# Altium project ArmBand-Sensor-Board_v2.0.PrjPcb
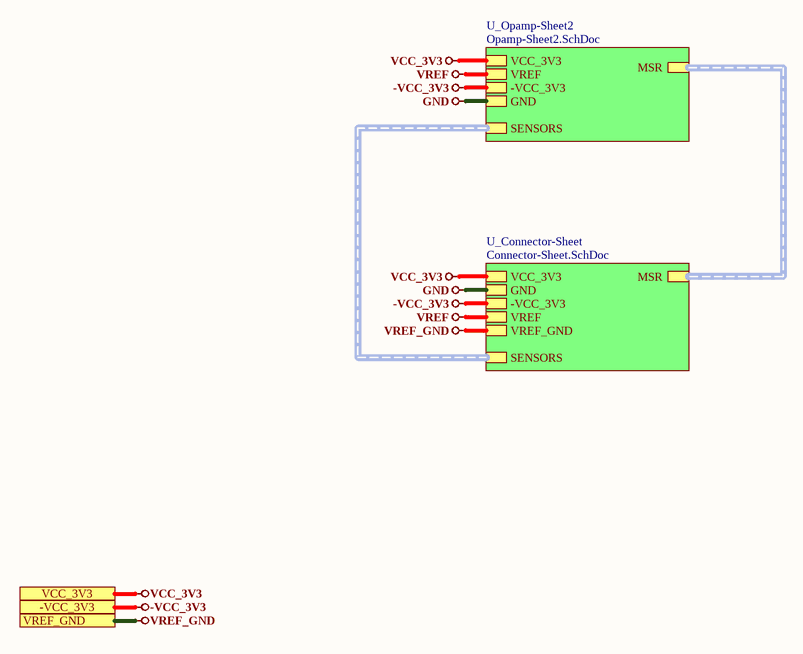
[diagram p0: Top-Sheet.SchDoc]
3 sheets, 46 parts. Net scope: hierarchical (ports join the sheet entries above them; power ports are global).
Board file: ArmBand-Sensor-Board_v2.0.PcbDoc
Sheets:
  Top-Sheet.SchDoc
    U_Opamp-Sheet2 = Opamp-Sheet2.SchDoc
    U_Connector-Sheet = Connector-Sheet.SchDoc

## Sheet Top-Sheet.SchDoc
size A4; DocumentNumber: 1; SheetNumber: 1; SheetTotal: 3

### Sub-sheets
U_Connector-Sheet = Connector-Sheet.SchDoc: SENSORS (harness SENSORS), MSR (harness MSR), -VCC_3V3, VCC_3V3, GND, VREF, VREF_GND
U_Opamp-Sheet2 = Opamp-Sheet2.SchDoc: SENSORS (harness SENSORS), -VCC_3V3, VREF, VCC_3V3, MSR (harness MSR), GND

### Ports
-VCC_3V3, VCC_3V3, VREF_GND

### Nets
-VCC_3V3: port -VCC_3V3, sheet U_Opamp-Sheet2/-VCC_3V3, sheet U_Connector-Sheet/-VCC_3V3
GND: sheet U_Opamp-Sheet2/GND, sheet U_Connector-Sheet/GND
VCC_3V3: port VCC_3V3, sheet U_Opamp-Sheet2/VCC_3V3, sheet U_Connector-Sheet/VCC_3V3
VREF: sheet U_Opamp-Sheet2/VREF, sheet U_Connector-Sheet/VREF
VREF_GND: port VREF_GND, sheet U_Connector-Sheet/VREF_GND

### Buses and harness runs
harness sheet U_Connector-Sheet/MSR = sheet U_Opamp-Sheet2/MSR
harness sheet U_Connector-Sheet/SENSORS = sheet U_Opamp-Sheet2/SENSORS

### Notes on the sheet
- 1
- Huzaifa Ali

## Sheet Opamp-Sheet2.SchDoc
size A4; DocumentNumber: 2; SheetNumber: 2; SheetTotal: 3
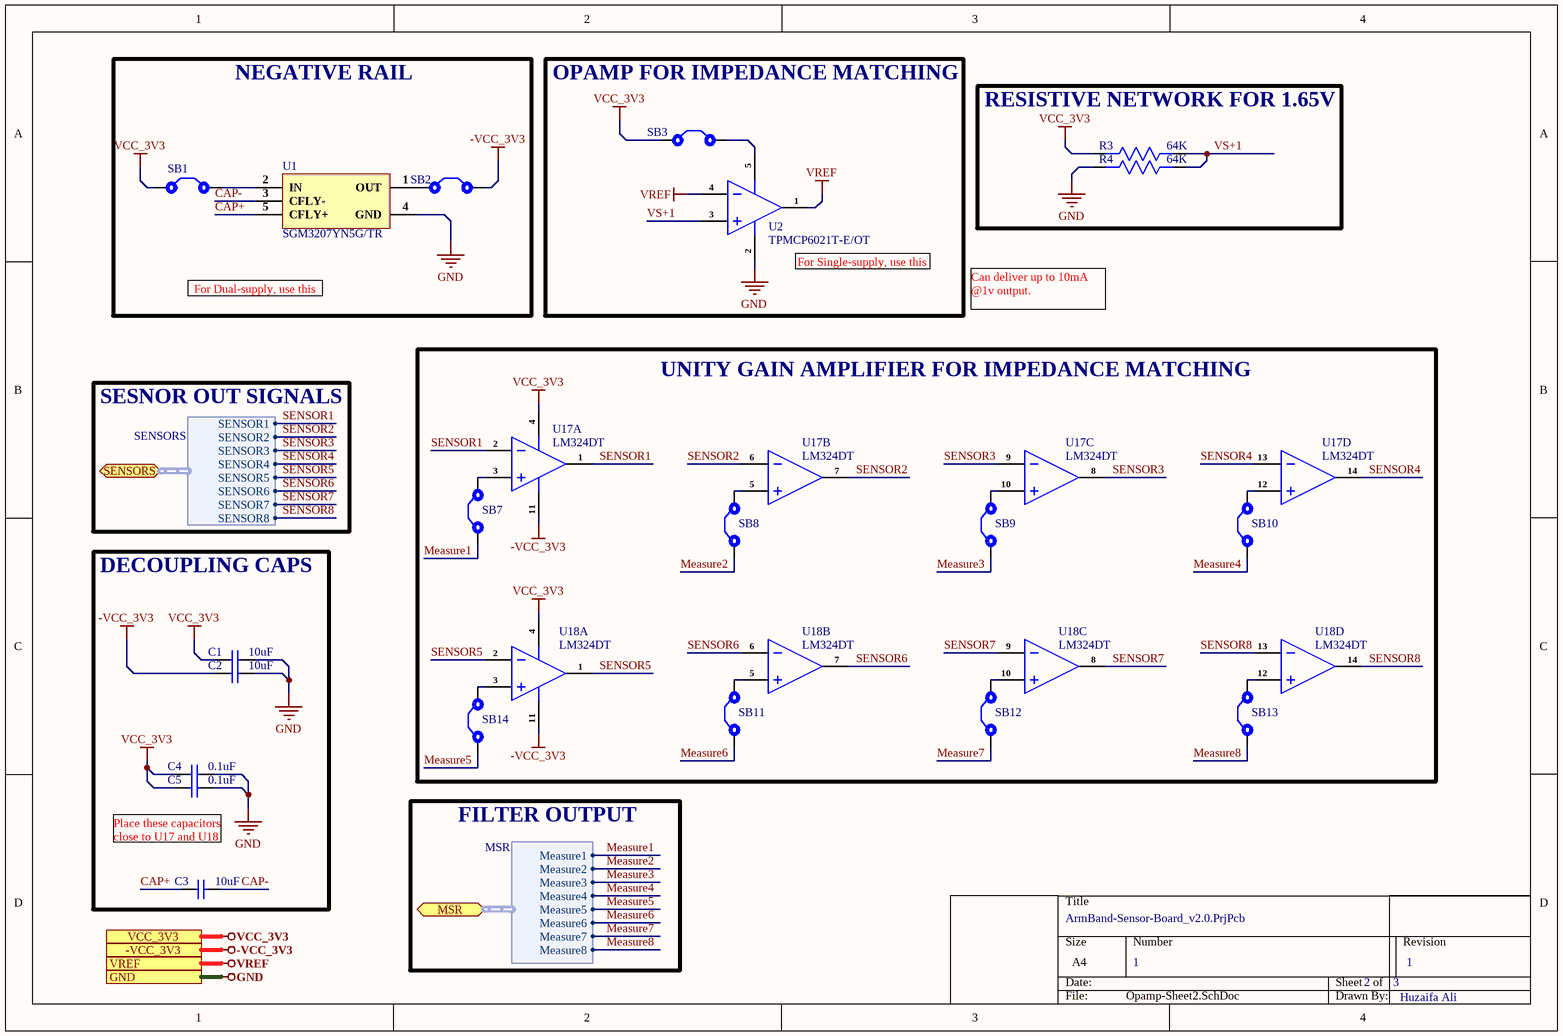
[diagram p1: Opamp-Sheet2.SchDoc]

### Parts
C1  10uF  [Cap-0603]
C2  10uF  [Cap-0603]
C3  10uF  [Cap-0603]
C4  0.1uF  [Cap-0402]
C5  0.1uF  [Cap-0402]
R3  64K  [Res-0603]
R4  64K  [Res-0603]
SB1  Solder Bridge  [Solder Bridge]  (value not drawn)
SB2  Solder Bridge  [Solder Bridge]  (value not drawn)
SB3  Solder Bridge  [Solder Bridge]  (value not drawn)
SB7  Solder Bridge 0603  [Solder Bridge]  (value not drawn)  (no BOM)
SB8  Solder Bridge 0603  [Solder Bridge]  (value not drawn)  (no BOM)
SB9  Solder Bridge 0603  [Solder Bridge]  (value not drawn)  (no BOM)
SB10  Solder Bridge 0603  [Solder Bridge]  (value not drawn)  (no BOM)
SB11  Solder Bridge 0603  [Solder Bridge]  (value not drawn)  (no BOM)
SB12  Solder Bridge 0603  [Solder Bridge]  (value not drawn)  (no BOM)
SB13  Solder Bridge 0603  [Solder Bridge]  (value not drawn)  (no BOM)
SB14  Solder Bridge 0603  [Solder Bridge]  (value not drawn)  (no BOM)
U1  SGM3207YN5G/TR  [SOT-23-5]
U2  TPMCP6021T-E/OT  [SOT-23-5]
U17  LM324DT  [SO-14]  (parts A,B,C,D of 4)
U18  LM324DT  [SO-14]  (parts A,B,C,D of 4)

### Blocks framed on the sheet
NEGATIVE RAIL: SB1 SB2 U1
OPAMP FOR IMPEDANCE MATCHING: SB3 U2
RESISTIVE NETWORK FOR 1.65V: R3 R4
UNITY GAIN AMPLIFIER FOR IMPEDANCE MATCHING: SB7-SB14 U17 U18
DECOUPLING CAPS: C1-C5

### Ports
-VCC_3V3, GND, MSR (bidir, harness MSR), SENSORS (bidir, harness SENSORS), VCC_3V3, VREF

### Harnesses
SENSORS: SENSOR1, SENSOR2, SENSOR3, SENSOR4, SENSOR5, SENSOR6, SENSOR7, SENSOR8
MSR: Measure1, Measure2, Measure3, Measure4, Measure5, Measure6, Measure7, Measure8

### Nets
-VCC_3V3: C2.1 SB2.2 U17.11(VCC-) U18.11(VCC-) ; port -VCC_3V3
GND: C1.2 C2.2 C4.2 C5.2 R4.2 U1.4(GND) U2.2(V-) ; port GND
VCC_3V3: C1.1 C4.1 C5.1 R3.2 SB1.1 SB3.1 U17.4(VCC+) U18.4(VCC+) ; port VCC_3V3
VREF: U2.1(OUT) U2.4(IN-) ; port VREF
CAP+: C3.1 U1.5(CFLY+)
CAP-: C3.2 U1.3(CFLY-)
Measure1: SB7.1 ; port MSR.Measure1
Measure2: SB8.1 ; port MSR.Measure2
Measure3: SB9.1 ; port MSR.Measure3
Measure4: SB10.1 ; port MSR.Measure4
Measure5: SB14.1 ; port MSR.Measure5
Measure6: SB11.1 ; port MSR.Measure6
Measure7: SB12.1 ; port MSR.Measure7
Measure8: SB13.1 ; port MSR.Measure8
SENSOR1: U17.1(1OUT) U17.2(IN-) ; port SENSORS.SENSOR1
SENSOR2: U17.6(2IN-) U17.7(2OUT) ; port SENSORS.SENSOR2
SENSOR3: U17.8(3OUT) U17.9(3IN-) ; port SENSORS.SENSOR3
SENSOR4: U17.13(4IN-) U17.14(4OUT) ; port SENSORS.SENSOR4
SENSOR5: U18.1(1OUT) U18.2(IN-) ; port SENSORS.SENSOR5
SENSOR6: U18.6(2IN-) U18.7(2OUT) ; port SENSORS.SENSOR6
SENSOR7: U18.8(3OUT) U18.9(3IN-) ; port SENSORS.SENSOR7
SENSOR8: U18.13(4IN-) U18.14(4OUT) ; port SENSORS.SENSOR8
VS+1: R3.1 R4.1 U2.3(IN+)
NetSB1_2: SB1.2 U1.2(IN)
NetSB2_1: SB2.1 U1.1(OUT)
NetSB3_2: SB3.2 U2.5(V+)
NetSB7_2: SB7.2 U17.3(IN+)
NetSB8_2: SB8.2 U17.5(2IN+)
NetSB9_2: SB9.2 U17.10(3IN+)
NetSB10_2: SB10.2 U17.12(4IN+)
NetSB11_2: SB11.2 U18.5(2IN+)
NetSB12_2: SB12.2 U18.10(3IN+)
NetSB13_2: SB13.2 U18.12(4IN+)
NetSB14_2: SB14.2 U18.3(IN+)

### Notes on the sheet
- For Dual-supply, use this
- (near U2) For Single-supply, use this
- Can deliver up to 10mA @1v output.
- SESNOR OUT SIGNALS
- Place these capacitors close to U17 and U18
- FILTER OUTPUT
- 1
- Huzaifa Ali

### Library data of the parts
C1-C3 = CL10A106MA8NRNC: CAP CER 10UF 25V X5R 0603; Manufacturer: Samsung; Tolerance: 20%; Supplier 1: Avnet; Manufacturer Part Number: CL10A106MA8NRNC; RoHS: Yes; Category: Ceramic Capacitors; Pricing 1: 4000=0.03753, 8000=0.03700, 16000=0.03595, 24000=0.03515, 32000=0.03383, 40000=0.03304, 400000=0.03225 (USD); Mount: Surface Mount; Case/Package: 0603; Case Code (Metric): 1608; Case Code (Imperial): 0603; Contact Plating: Tin; Min Operating Temperature: -55°C; Max Operating Temperature: 85°C; Package Quantity: 1; Packaging: Tape and Reel; Capacitance: 10uF; Voltage Rating: 25V; Dielectric: X5R; Termination: Wraparound; Series: CL; Construction: Flat; Length: 0.063inch; Width: 0.031inch; Thickness: 0.035inch; Lead Free: Lead Free; RoHS Compliant: Yes; ComponentLink1URL: https://datasheet.ciiva.com/25766/cl10a106ma8nrnc-25766562.pdf?src-supplier=Digi-Key; ComponentLink1Description: https://datasheet.ciiva.com/25766/cl10a106ma8nrnc-25766562.pdf?src-supplier=Digi-Key; Supplier Part Number 1: CL10A106MA8NRNC; LCSC Part Number: C96446
C4 C5 = GRM155R71H104ME14D: CAP CER 0.1UF 50V X7R 0402; Manufacturer: Murata; Tolerance: 20%; Capacitance: 100nF; Item Type: Capacitor; Supplier 1: Avnet; Manufacturer Part Number: GRM155R71H104ME14D; Stock 1: 100000; Pricing 1: 10000=0.00444, 20000=0.00420, 40000=0.00396, 60000=0.00372, 80000=0.00348, 100000=0.00324, 1000000=0.00300 (USD); Mount: Surface Mount; Case/Package: 0402; Min Operating Temperature: -55°C; Max Operating Temperature: 125°C; Packaging: Cut Tape; Voltage Rating: 50V; Length: 0.039inch; Width: 0.02inch; Thickness: 0.022inch; ComponentLink1URL: http://www.mouser.com/ds/2/281/c02e-2905.pdf?src-supplier=Mouser; ComponentLink1Description: http://www.mouser.com/ds/2/281/c02e-2905.pdf?src-supplier=Mouser; ComponentLink2URL: http://search.murata.co.jp/Ceramy/image/img/A01X/G101/ENG/GRM155R71H104ME14-01.pdf?src-supplier=Digi-Key; ComponentLink2Description: http://search.murata.co.jp/Ceramy/image/img/A01X/G101/ENG/GRM155R71H104ME14-01.pdf?src-supplier=Digi-Key; ComponentLink3URL: http://psearch.en.murata.com/capacitor/product/GRM155R71H104ME14%23.pdf?src-supplier=Avnet; ComponentLink3Description: http://psearch.en.murata.com/capacitor/product/GRM155R71H104ME14%23.pdf?src-supplier=Avnet; Supplier Part Number 1: GRM155R71H104ME14D; RoHS: Yes; Category: Ceramic Capacitors; RoHS Compliant: Yes; LCSC Part Number: C182412
R3 R4 = ARG03DTC6402N: 1/10W Thin Film Resistor 75V ±0.5% ±25ppm/℃ -55℃~+155℃ 64kΩ 0603 Chip Resistor - Surface Mount ROHS; Manufacturer: iking Tech; Value: 64K; Manufacturer Part Number: ARG03DTC6402N; Footprint: 0603; ComponentLink1Description: LCSC; ComponentLink1URL: https://lcsc.com/product-detail/Chip-Resistor-Surface-Mount_Viking-Tech-ARG03DTC6402N_C2902643.html; LCSC Part Number: C2902643; Item Type: Resistor
SB1-SB3 = Solder Bridge: Solder Bridge ON
SB7-SB14 = Solder Bridge 0603: Solder Bridge ON; Manufacturer Part Number: Solder Bridge; Item Type: Solder Bridge
U1 = SGM3207YN5G/TR: NO Charge pump 1 -5.5V~-1.4V 1.4V~5.5V 60mA 19kHz SOT-23-5 DC-DC Converters ROHS; Manufacturer: SG Micro; Item Type: IC; Supplier 1: Avnet; Manufacturer Part Number: SGM3207YN5G/TR; RoHS: No; Category: Uncategorized; Pricing 1: 3000=0.38750, 6000=0.36250, 12000=0.33750, 18000=0.32500, 24000=0.31250, 30000=0.31250, 300000=0.30500 (USD); LCSC Part Number: C80403; Supplier Part Number 1: SGM3207YN5G/TR
U2 = TPMCP6021T-E/OT: SOT-23-5 Operational Amplifier ROHS; Manufacturer: TECH PUBLIC; Item Type: IC; Manufacturer Part Number: TPMCP6021T-E/OT; LCSC Part Number: C2923365; ComponentLink1Description: LCSC; ComponentLink1URL: https://www.lcsc.com/product-detail/Operational-Amplifier_TECH-PUBLIC-TPMCP6021T-E-OT_C2923365.html
U17 U18 = LM324DT: IC OPAMP GP 1.3MHZ 14SO; Manufacturer: STMicroelectronics; Max Supply Voltage: 30V; Min Supply Voltage: 3V; Min Dual Supply Voltage: 1.5V; Max Dual Supply Voltage: 15V; Voltage Gain: 100dB; Slew Rate: 0.4V/µs; Common Mode Rejection Ratio: 70dB; Nominal Supply Current: 1.2mA; Input Offset Voltage (Vos): 7mV; Input Bias Current: 150nA; Number of Circuits: 4; Output Current per Channel: 40mA; Dual Supply Voltage: 12V; Supply Type: Single,Dual; Input Voltage Noise Density: 40nV/sqrt Hz; Max Power Dissipation: 400mW; Supplier 1: Arrow Electronics; Manufacturer Part Number: LM324DT; RoHS: Yes; Category: Amplifiers - Op Amps, Buffer, Instrumentation; Stock 1: 287500; Pricing 1: 2500=0.18900 (USD); Mount: Surface Mount; Case/Package: SO; Number of Pins: 14; Contact Plating: Tin,Matte; Weight: 0.009143oz; Min Operating Temperature: 0°C; Max Operating Temperature: 70°C; Gain Bandwidth Product: 1.3MHz; Packaging: Cut Tape; Package Quantity: 2500; Operating Supply Current: 1.2mA; Operating Supply Voltage: 15V; Number of Channels: 4; Output Current: 40mA; Number of Elements: 4; Series: LM324; Technology: BIPOLAR; Bandwidth: 1.3MHz; Number of Amplifiers: 4; Unity Gain Bandwidth Product: 1.3MHz; Length: 8.75mm; Width: 4mm; Height: 1.65mm; Radiation Hardening: No; RoHS Compliant: Yes; Lead Free: Lead Free; REACH SVHC: No SVHC; ComponentLink1URL: https://datasheet.ciiva.com/4758/cd00000457-103203-4758032.pdf?src-supplier=Mouser; ComponentLink1Description: https://datasheet.ciiva.com/4758/cd00000457-103203-4758032.pdf?src-supplier=Mouser; ComponentLink2URL: https://datasheet.ciiva.com/8008/1834360-8008827.pdf?src-supplier=Element14; ComponentLink2Description: https://datasheet.ciiva.com/8008/1834360-8008827.pdf?src-supplier=Element14; ComponentLink3URL: https://datasheet.ciiva.com/8008/1834360-8008490.pdf?src-supplier=Element14; ComponentLink3Description: https://datasheet.ciiva.com/8008/1834360-8008490.pdf?src-supplier=Element14; ComponentLink4URL: https://datasheet.ciiva.com/28630/1834360-28630538.pdf?src-supplier=Element14; ComponentLink4Description: https://datasheet.ciiva.com/28630/1834360-28630538.pdf?src-supplier=Element14; ComponentLink5URL: https://datasheet.ciiva.com/1795/cd00000457-1795560.pdf?src-supplier=Digi-Key; ComponentLink5Description: https://datasheet.ciiva.com/1795/cd00000457-1795560.pdf?src-supplier=Digi-Key; ComponentLink6URL: https://datasheet.ciiva.com/1795/cd00000457-1795559.pdf?src-supplier=Digi-Key; ComponentLink6Description: https://datasheet.ciiva.com/1795/cd00000457-1795559.pdf?src-supplier=Digi-Key; ComponentLink7URL: https://datasheet.ciiva.com/1795/cd00000457-1795561.pdf?src-supplier=Digi-Key; ComponentLink7Description: https://datasheet.ciiva.com/1795/cd00000457-1795561.pdf?src-supplier=Digi-Key; ComponentLink8URL: https://datasheet.ciiva.com/16375/cd00000457-16375528.pdf?src-supplier=Future+Electronics; ComponentLink8Description: https://datasheet.ciiva.com/16375/cd00000457-16375528.pdf?src-supplier=Future+Electronics; Supplier Part Number 1: LM324DT

## Sheet Connector-Sheet.SchDoc
size A4; DocumentNumber: 3; SheetNumber: 3; SheetTotal: 3
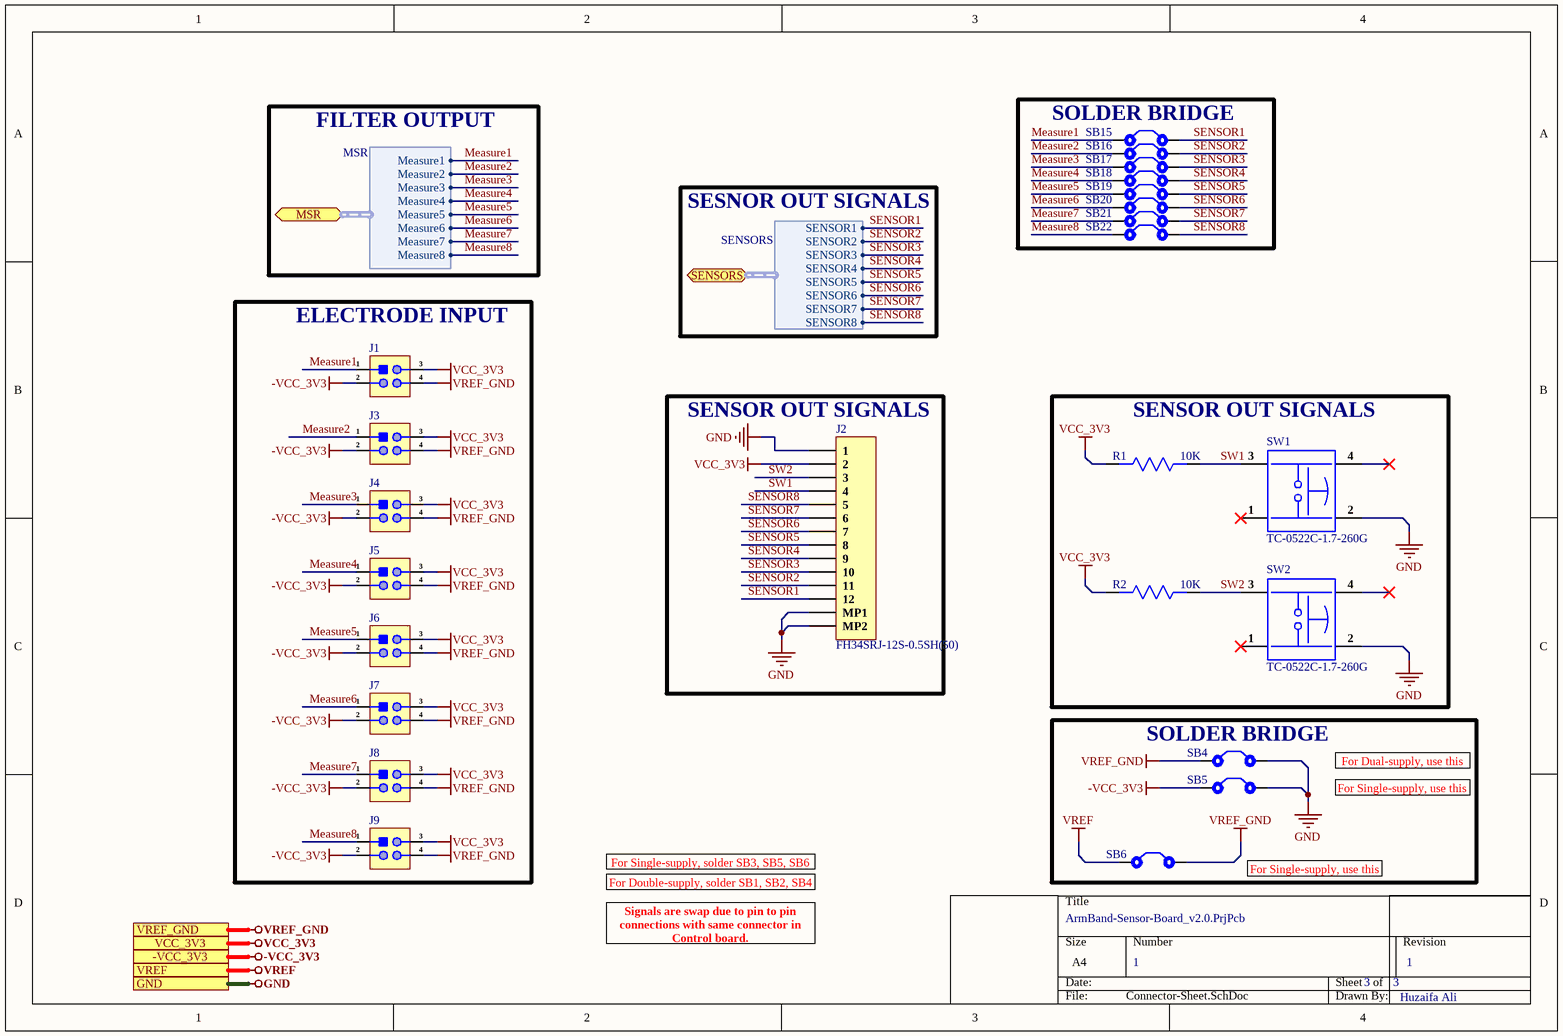
[diagram p2: Connector-Sheet.SchDoc]

### Parts
J1  2x2 Pad  [2x2 Pad]  (value not drawn)  (no BOM)
J2  FH34SRJ-12S-0.5SH(50)  [FH34SRJ-12S-0.5SH(50)_]
J3  2x2 Pad  [2x2 Pad]  (value not drawn)  (no BOM)
J4  2x2 Pad  [2x2 Pad]  (value not drawn)  (no BOM)
J5  2x2 Pad  [2x2 Pad]  (value not drawn)  (no BOM)
J6  2x2 Pad  [2x2 Pad]  (value not drawn)  (no BOM)
J7  2x2 Pad  [2x2 Pad]  (value not drawn)  (no BOM)
J8  2x2 Pad  [2x2 Pad]  (value not drawn)  (no BOM)
J9  2x2 Pad  [2x2 Pad]  (value not drawn)  (no BOM)
R1  10K  [Res-0402]
R2  10K  [Res-0402]
SB4  Solder Bridge  [Solder Bridge]  (value not drawn)
SB5  Solder Bridge  [Solder Bridge]  (value not drawn)
SB6  Solder Bridge  [Solder Bridge]  (value not drawn)
SB15  Solder Bridge 0603  [Solder Bridge]  (value not drawn)  (no BOM)
SB16  Solder Bridge 0603  [Solder Bridge]  (value not drawn)  (no BOM)
SB17  Solder Bridge 0603  [Solder Bridge]  (value not drawn)  (no BOM)
SB18  Solder Bridge 0603  [Solder Bridge]  (value not drawn)  (no BOM)
SB19  Solder Bridge 0603  [Solder Bridge]  (value not drawn)  (no BOM)
SB20  Solder Bridge 0603  [Solder Bridge]  (value not drawn)  (no BOM)
SB21  Solder Bridge 0603  [Solder Bridge]  (value not drawn)  (no BOM)
SB22  Solder Bridge 0603  [Solder Bridge]  (value not drawn)  (no BOM)
SW1  TC-0522C-1.7-260G  [TC-0522C-1.7-260G_]
SW2  TC-0522C-1.7-260G  [TC-0522C-1.7-260G_]

### Blocks framed on the sheet
SOLDER BRIDGE: SB15-SB22
ELECTRODE INPUT: J1 J3-J9
SENSOR OUT SIGNALS: J2
SENSOR OUT SIGNALS: R1 R2 SW1 SW2
SOLDER BRIDGE: SB4-SB6

### Ports
-VCC_3V3, GND, MSR (bidir, harness MSR), SENSORS (bidir, harness SENSORS), VCC_3V3, VREF, VREF_GND

### Harnesses
SENSORS: SENSOR1, SENSOR2, SENSOR3, SENSOR4, SENSOR5, SENSOR6, SENSOR7, SENSOR8
MSR: Measure1, Measure2, Measure3, Measure4, Measure5, Measure6, Measure7, Measure8

### Nets
-VCC_3V3: J1.2 J3.2 J4.2 J5.2 J6.2 J7.2 J8.2 J9.2 SB5.1 ; port -VCC_3V3
GND: J2.1 J2.MP1 J2.MP2 SB4.2 SB5.2 SW1.2 SW2.2 ; port GND
VCC_3V3: J1.3 J2.2 J3.3 J4.3 J5.3 J6.3 J7.3 J8.3 J9.3 R1.2 R2.2 ; port VCC_3V3
VREF: SB6.1 ; port VREF
VREF_GND: J1.4 J3.4 J4.4 J5.4 J6.4 J7.4 J8.4 J9.4 SB4.1 SB6.2 ; port VREF_GND
Measure1: J1.1 SB15.1 ; port MSR.Measure1
Measure2: J3.1 SB16.1 ; port MSR.Measure2
Measure3: J4.1 SB17.1 ; port MSR.Measure3
Measure4: J5.1 SB18.1 ; port MSR.Measure4
Measure5: J6.1 SB19.1 ; port MSR.Measure5
Measure6: J7.1 SB20.1 ; port MSR.Measure6
Measure7: J8.1 SB21.1 ; port MSR.Measure7
Measure8: J9.1 SB22.1 ; port MSR.Measure8
SENSOR1: J2.12 SB15.2 ; port SENSORS.SENSOR1
SENSOR2: J2.11 SB16.2 ; port SENSORS.SENSOR2
SENSOR3: J2.10 SB17.2 ; port SENSORS.SENSOR3
SENSOR4: J2.9 SB18.2 ; port SENSORS.SENSOR4
SENSOR5: J2.8 SB19.2 ; port SENSORS.SENSOR5
SENSOR6: J2.7 SB20.2 ; port SENSORS.SENSOR6
SENSOR7: J2.6 SB21.2 ; port SENSORS.SENSOR7
SENSOR8: J2.5 SB22.2 ; port SENSORS.SENSOR8
SW1: J2.4 R1.1 SW1.3
SW2: J2.3 R2.1 SW2.3

Not connected (* = marked no-connect by the designer): SW1 1* 4*; SW2 1* 4*

### Notes on the sheet
- FILTER OUTPUT
- SESNOR OUT SIGNALS
- For Single-supply, use this
- For Dual-supply, use this
- For Single-supply, solder SB3, SB5, SB6
- For Double-supply, solder SB1, SB2, SB4
- Signals are swap due to pin to pin connections with same connector in Control board.
- 1
- Huzaifa Ali

### Library data of the parts
J1 J3-J9 = 2x2 Pad: Wire Connecting Pad
J2 = FH34SRJ-12S-0.5SH(50): CONN FPC/FFC 12POS .5MM; Manufacturer: Hirose; Item Type: FFC Connector; Supplier 1: Digi-Key; Manufacturer Part Number: FH34SRJ-12S-0.5SH(50); RoHS: Yes; Category: FFC / FPC; Pricing 1: 5000=0.47775 (USD); ComponentLink1URL: https://www.hirose.com/product/en/download_file/key_name/FH34SRJ/category/Catalog/doc_file_id/31646/?file_category_id=4&item_id=27&is_series=1&src-supplier=Digi-Key; ComponentLink1Description: https://www.hirose.com/product/en/download_file/key_name/FH34SRJ/category/Catalog/doc_file_id/31646/?file_category_id=4&item_id=27&is_series=1&src-supplier=Digi-Key; Supplier Part Number 1: FH34SRJ-12S-0.5SH(50)-ND; LCSC Part Number: C424659
R1 R2 = RC0402FR-0710KL: RES 10K OHM 1% 1/16W 0402; Manufacturer: Yageo; Resistance: 10kR; Temperature Coefficient: 100ppm/°C; Voltage Rating (DC): 50V; Power Rating: 62.5mW; Max Power Dissipation: 63mW; Supplier 1: Mouser; Manufacturer Part Number: RC0402FR-0710KL; Stock 1: 18648329; Pricing 1: 1=0.10000, 10=0.01400, 50=0.01400, 100=0.00500, 1000=0.00300, 10000=0.00200 (USD); Case/Package: 0402; Number of Pins: 2; Case Code (Imperial): 0402; Case Code (Metric): 1005; Min Operating Temperature: -55°C; Max Operating Temperature: 155°C; Tolerance: 1%; Packaging: Tape and Reel; Voltage Rating: 50V; Termination: SMD/SMT; Military Standard: Not; Working Voltage: 50V; Number of Terminations: 2; Length: 1mm; Height: 0.32mm; Width: 0.5mm; Depth: 0.5mm; Lead Pitch: 0.2mm; REACH SVHC: No SVHC; Lead Free: Lead Free; ComponentLink1URL: https://datasheet.ciiva.com/7660/38568-7660787.pdf?src-supplier=Element14; ComponentLink1Description: https://datasheet.ciiva.com/7660/38568-7660787.pdf?src-supplier=Element14; ComponentLink2URL: https://datasheet.ciiva.com/7849/1686128-7849814.pdf?src-supplier=Element14; ComponentLink2Description: https://datasheet.ciiva.com/7849/1686128-7849814.pdf?src-supplier=Element14; ComponentLink3URL: https://datasheet.ciiva.com/7983/1018594-7983486.pdf?src-supplier=Element14; ComponentLink3Description: https://datasheet.ciiva.com/7983/1018594-7983486.pdf?src-supplier=Element14; ComponentLink4URL: https://datasheet.ciiva.com/22747/1018594-22747512.pdf?src-supplier=Element14; ComponentLink4Description: https://datasheet.ciiva.com/22747/1018594-22747512.pdf?src-supplier=Element14; Supplier Part Number 1: 603-RC0402FR-0710KL; RoHS: Yes; Category: Chip SMD Resistors; Resistor Type: Thick Film; Features: Moisture Resistant; Series: RC; Resistance Tolerance: 1%; Construction: Rectangular; RoHS Compliant: Yes; ComponentLink5URL: https://datasheet.ciiva.com/12667/pyu-rc0402-51-rohs-l-6-r-12667067.pdf?src-supplier=Mouser; ComponentLink5Description: https://datasheet.ciiva.com/12667/pyu-rc0402-51-rohs-l-6-r-12667067.pdf?src-supplier=Mouser; ComponentLink6URL: https://datasheet.ciiva.com/7849/1784430-7849813.pdf?src-supplier=Element14; ComponentLink6Description: https://datasheet.ciiva.com/7849/1784430-7849813.pdf?src-supplier=Element14; ComponentLink7URL: https://datasheet.ciiva.com/7849/1784430-7849815.pdf?src-supplier=Element14; ComponentLink7Description: https://datasheet.ciiva.com/7849/1784430-7849815.pdf?src-supplier=Element14; LCSC Part Number: C60490
SB4-SB6 = Solder Bridge: Solder Bridge ON
SB15-SB22 = Solder Bridge 0603: Solder Bridge ON; Manufacturer Part Number: Solder Bridge; Item Type: Solder Bridge
SW1 SW2 = TC-0522C-1.7-260G: No Gull Wing 50mA 100MΩ 80000 260gf@±50gf 12V -25℃~+85℃ 1.7mm Golden Round Button Brick nogging SPST SMD Tactile Switches ROHS; Manufacturer: HCTL; Item Type: Switch; Manufacturer Part Number: TC-0522C-1.7-260G; Value: -; Footprint: Custom; ComponentLink1Description: LCSC; ComponentLink1URL: https://www.lcsc.com/product-detail/Tactile-Switches_HCTL-TC-0522C-1-7-260G_C2845290.html; LCSC Part Number: C2845290

## Nets that join several sheets
-VCC_3V3: Opamp-Sheet2 (C2.1 SB2.2 U17.11 U18.11), Connector-Sheet (9 pins)
GND: Opamp-Sheet2 (7 pins), Connector-Sheet (7 pins)
VCC_3V3: Opamp-Sheet2 (8 pins), Connector-Sheet (11 pins)
VREF: Opamp-Sheet2 (U2.1 U2.4), Connector-Sheet (SB6.1)
Measure1: Opamp-Sheet2 (SB7.1), Connector-Sheet (J1.1 SB15.1)
Measure2: Opamp-Sheet2 (SB8.1), Connector-Sheet (J3.1 SB16.1)
Measure3: Opamp-Sheet2 (SB9.1), Connector-Sheet (J4.1 SB17.1)
Measure4: Opamp-Sheet2 (SB10.1), Connector-Sheet (J5.1 SB18.1)
Measure5: Opamp-Sheet2 (SB14.1), Connector-Sheet (J6.1 SB19.1)
Measure6: Opamp-Sheet2 (SB11.1), Connector-Sheet (J7.1 SB20.1)
Measure7: Opamp-Sheet2 (SB12.1), Connector-Sheet (J8.1 SB21.1)
Measure8: Opamp-Sheet2 (SB13.1), Connector-Sheet (J9.1 SB22.1)
SENSOR1: Opamp-Sheet2 (U17.1 U17.2), Connector-Sheet (J2.12 SB15.2)
SENSOR2: Opamp-Sheet2 (U17.6 U17.7), Connector-Sheet (J2.11 SB16.2)
SENSOR3: Opamp-Sheet2 (U17.8 U17.9), Connector-Sheet (J2.10 SB17.2)
SENSOR4: Opamp-Sheet2 (U17.13 U17.14), Connector-Sheet (J2.9 SB18.2)
SENSOR5: Opamp-Sheet2 (U18.1 U18.2), Connector-Sheet (J2.8 SB19.2)
SENSOR6: Opamp-Sheet2 (U18.6 U18.7), Connector-Sheet (J2.7 SB20.2)
SENSOR7: Opamp-Sheet2 (U18.8 U18.9), Connector-Sheet (J2.6 SB21.2)
SENSOR8: Opamp-Sheet2 (U18.13 U18.14), Connector-Sheet (J2.5 SB22.2)